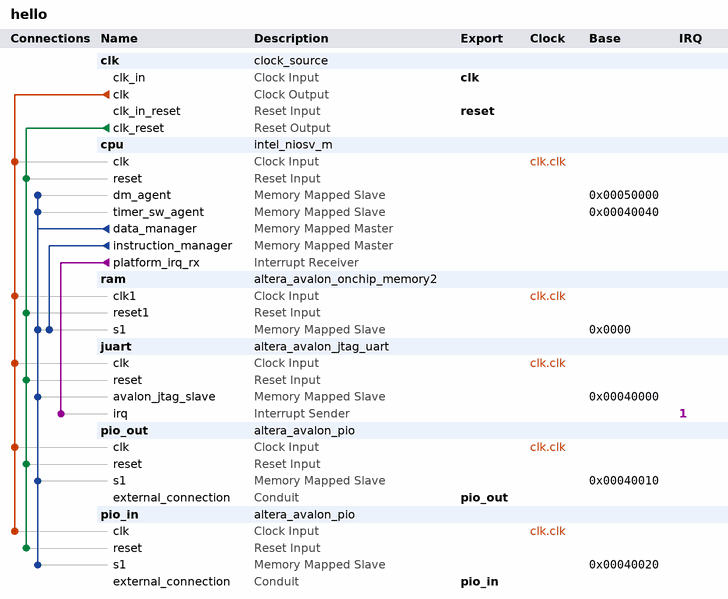
[diagram p0: system contents]
# Platform Designer (Qsys) system hello, Cyclone V 5CSEMA5F31C6
# Parameters at their usual value, and those the tool derives, are not listed.
package require -exact qsys 25.1
create_system hello
set_project_property DEVICE_FAMILY {Cyclone V}
set_project_property DEVICE 5CSEMA5F31C6

add_instance clk clock_source 25.1
set_instance_parameter_value clk clockFrequency 50000000

add_instance cpu intel_niosv_m 26.0.0
set_instance_parameter_value cpu enableAvalonInterface false
set_instance_parameter_value cpu enableDebugReset false
set_instance_parameter_value cpu enableECCFull false
set_instance_parameter_value cpu enableECCLite false
set_instance_parameter_value cpu hartId 0
set_instance_parameter_value cpu interruptMode 0
set_instance_parameter_value cpu pipelineArch true
set_instance_parameter_value cpu resetSlave ram.s1

add_instance ram altera_avalon_onchip_memory2 25.1
set_instance_parameter_value ram dataWidth 32
set_instance_parameter_value ram dualPort false
set_instance_parameter_value ram initMemContent true
set_instance_parameter_value ram initializationFileName ram.hex
set_instance_parameter_value ram memorySize 262144
set_instance_parameter_value ram useNonDefaultInitFile true

add_instance juart altera_avalon_jtag_uart 25.1
set_instance_parameter_value juart simInteractiveOptions NO_INTERACTIVE_WINDOWS

add_instance pio_out altera_avalon_pio 25.1
set_instance_parameter_value pio_out direction Output
set_instance_parameter_value pio_out width 8

add_instance pio_in altera_avalon_pio 25.1
set_instance_parameter_value pio_in direction Input
set_instance_parameter_value pio_in width 4

# connections
add_connection clk.clk cpu.clk clock
add_connection clk.clk juart.clk clock
add_connection clk.clk pio_in.clk clock
add_connection clk.clk pio_out.clk clock
add_connection clk.clk ram.clk1 clock
add_connection clk.clk_reset cpu.reset reset
add_connection clk.clk_reset juart.reset reset
add_connection clk.clk_reset pio_in.reset reset
add_connection clk.clk_reset pio_out.reset reset
add_connection clk.clk_reset ram.reset1 reset
add_connection cpu.data_manager cpu.dm_agent avalon
set_connection_parameter_value cpu.data_manager/cpu.dm_agent baseAddress 0x00050000
add_connection cpu.data_manager cpu.timer_sw_agent avalon
set_connection_parameter_value cpu.data_manager/cpu.timer_sw_agent baseAddress 0x00040040
add_connection cpu.data_manager juart.avalon_jtag_slave avalon
set_connection_parameter_value cpu.data_manager/juart.avalon_jtag_slave baseAddress 0x00040000
add_connection cpu.data_manager pio_in.s1 avalon
set_connection_parameter_value cpu.data_manager/pio_in.s1 baseAddress 0x00040020
add_connection cpu.data_manager pio_out.s1 avalon
set_connection_parameter_value cpu.data_manager/pio_out.s1 baseAddress 0x00040010
add_connection cpu.data_manager ram.s1 avalon
set_connection_parameter_value cpu.data_manager/ram.s1 baseAddress 0x0000
add_connection cpu.instruction_manager ram.s1 avalon
set_connection_parameter_value cpu.instruction_manager/ram.s1 baseAddress 0x0000
add_connection cpu.platform_irq_rx juart.irq interrupt
set_connection_parameter_value cpu.platform_irq_rx/juart.irq irqNumber 1

# exported interfaces
add_interface clk clock sink
set_interface_property clk EXPORT_OF clk.clk_in
add_interface pio_in conduit end
set_interface_property pio_in EXPORT_OF pio_in.external_connection
add_interface pio_out conduit end
set_interface_property pio_out EXPORT_OF pio_out.external_connection
add_interface reset reset sink
set_interface_property reset EXPORT_OF clk.clk_in_reset

set_interconnect_requirement {$system} qsys_mm.clockCrossingAdapter HANDSHAKE
set_interconnect_requirement {$system} qsys_mm.enableEccProtection FALSE
set_interconnect_requirement {$system} qsys_mm.insertDefaultSlave FALSE
set_interconnect_requirement {$system} qsys_mm.maxAdditionalLatency 1

save_system hello.qsys
